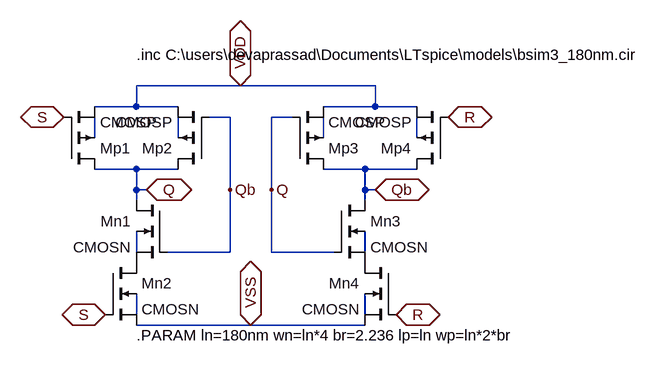
[diagram p0: schematic srlatch.asc]
srlatch.asc, the LTspice schematic file:
Version 4.1
SHEET 1 880 680
WIRE 272 16 112 16
WIRE 480 16 272 16
WIRE 112 48 112 16
WIRE 112 48 48 48
WIRE 176 48 112 48
WIRE 480 48 480 16
WIRE 480 48 400 48
WIRE 544 48 480 48
WIRE 256 64 224 64
WIRE 352 64 320 64
WIRE 48 96 48 64
WIRE 176 96 176 64
WIRE 400 96 400 64
WIRE 544 96 544 64
WIRE 112 144 48 144
WIRE 176 144 112 144
WIRE 464 144 400 144
WIRE 544 144 464 144
WIRE 112 176 112 144
WIRE 128 176 112 176
WIRE 256 176 256 64
WIRE 320 176 320 64
WIRE 464 176 464 144
WIRE 480 176 464 176
WIRE 112 192 112 176
WIRE 464 192 464 176
WIRE 112 272 112 240
WIRE 256 272 256 176
WIRE 256 272 160 272
WIRE 320 272 320 176
WIRE 416 272 320 272
WIRE 464 272 464 240
WIRE 112 368 112 336
WIRE 464 368 464 336
WIRE 288 384 112 384
WIRE 464 384 288 384
FLAG 64 368 S
IOPIN 64 368 BiDir
FLAG 0 64 S
IOPIN 0 64 BiDir
FLAG 592 64 R
IOPIN 592 64 BiDir
FLAG 512 368 R
IOPIN 512 368 BiDir
FLAG 128 176 Q
IOPIN 128 176 BiDir
FLAG 480 176 Qb
IOPIN 480 176 BiDir
FLAG 288 384 VSS
IOPIN 288 384 BiDir
FLAG 272 16 VDD
IOPIN 272 16 BiDir
FLAG 256 176 Qb
FLAG 320 176 Q
SYMBOL pmos4 0 144 M180
SYMATTR InstName Mp1
SYMATTR Value CMOSP
SYMATTR Value2 l={lp} w={wp} ad={lp*wp} as={lp*wp} pd={2*lp+wp} ps={2*lp+wp}
SYMBOL pmos4 224 144 R180
SYMATTR InstName Mp2
SYMATTR Value CMOSP
SYMATTR Value2 l={lp} w={wp} ad={lp*wp} as={lp*wp} pd={2*lp+wp} ps={2*lp+wp}
SYMBOL pmos4 352 144 M180
SYMATTR InstName Mp3
SYMATTR Value CMOSP
SYMATTR Value2 l={lp} w={wp} ad={lp*wp} as={lp*wp} pd={2*lp+wp} ps={2*lp+wp}
SYMBOL pmos4 592 144 R180
SYMATTR InstName Mp4
SYMATTR Value CMOSP
SYMATTR Value2 l={lp} w={wp} ad={lp*wp} as={lp*wp} pd={2*lp+wp} ps={2*lp+wp}
SYMBOL nmos4 160 192 M0
SYMATTR InstName Mn1
SYMATTR Value CMOSN
SYMATTR Value2 l={ln} w={wn} ad={ln*wn} as={ln*wn} pd={2*ln+wn} ps={2*ln+wn}
SYMBOL nmos4 64 288 R0
SYMATTR InstName Mn2
SYMATTR Value CMOSN
SYMATTR Value2 l={ln} w={wn} ad={ln*wn} as={ln*wn} pd={2*ln+wn} ps={2*ln+wn}
SYMBOL nmos4 416 192 R0
SYMATTR InstName Mn3
SYMATTR Value CMOSN
SYMATTR Value2 l={ln} w={wn} ad={ln*wn} as={ln*wn} pd={2*ln+wn} ps={2*ln+wn}
SYMBOL nmos4 512 288 M0
SYMATTR InstName Mn4
SYMATTR Value CMOSN
SYMATTR Value2 l={ln} w={wn} ad={ln*wn} as={ln*wn} pd={2*ln+wn} ps={2*ln+wn}
TEXT 112 -32 Left 2 !.inc C:\\users\\devaprassad\\Documents\\LTspice\\models\\bsim3_180nm.cir
TEXT 112 400 Left 2 !.PARAM ln=180nm wn=ln*4 br=2.236 lp=ln wp=ln*2*br

The netlist it stands for:
* srlatch.asc
Mp1 Q S VDD N001 CMOSP l={lp} w={wp} ad={lp*wp} as={lp*wp} pd={2*lp+wp} ps={2*lp+wp}
Mp2 Q Qb VDD N002 CMOSP l={lp} w={wp} ad={lp*wp} as={lp*wp} pd={2*lp+wp} ps={2*lp+wp}
Mp3 Qb Q VDD N003 CMOSP l={lp} w={wp} ad={lp*wp} as={lp*wp} pd={2*lp+wp} ps={2*lp+wp}
Mp4 Qb R VDD N004 CMOSP l={lp} w={wp} ad={lp*wp} as={lp*wp} pd={2*lp+wp} ps={2*lp+wp}
Mn1 Q Qb P001 N005 CMOSN l={ln} w={wn} ad={ln*wn} as={ln*wn} pd={2*ln+wn} ps={2*ln+wn}
Mn2 P001 S VSS N007 CMOSN l={ln} w={wn} ad={ln*wn} as={ln*wn} pd={2*ln+wn} ps={2*ln+wn}
Mn3 Qb Q P002 N006 CMOSN l={ln} w={wn} ad={ln*wn} as={ln*wn} pd={2*ln+wn} ps={2*ln+wn}
Mn4 P002 R VSS N008 CMOSN l={ln} w={wn} ad={ln*wn} as={ln*wn} pd={2*ln+wn} ps={2*ln+wn}
.model NMOS NMOS
.model PMOS PMOS
.lib standard.mos
.inc C:\users\devaprassad\Documents\LTspice\models\bsim3_180nm.cir
.PARAM ln=180nm wn=ln*4 br=2.236 lp=ln wp=ln*2*br
.backanno
.end